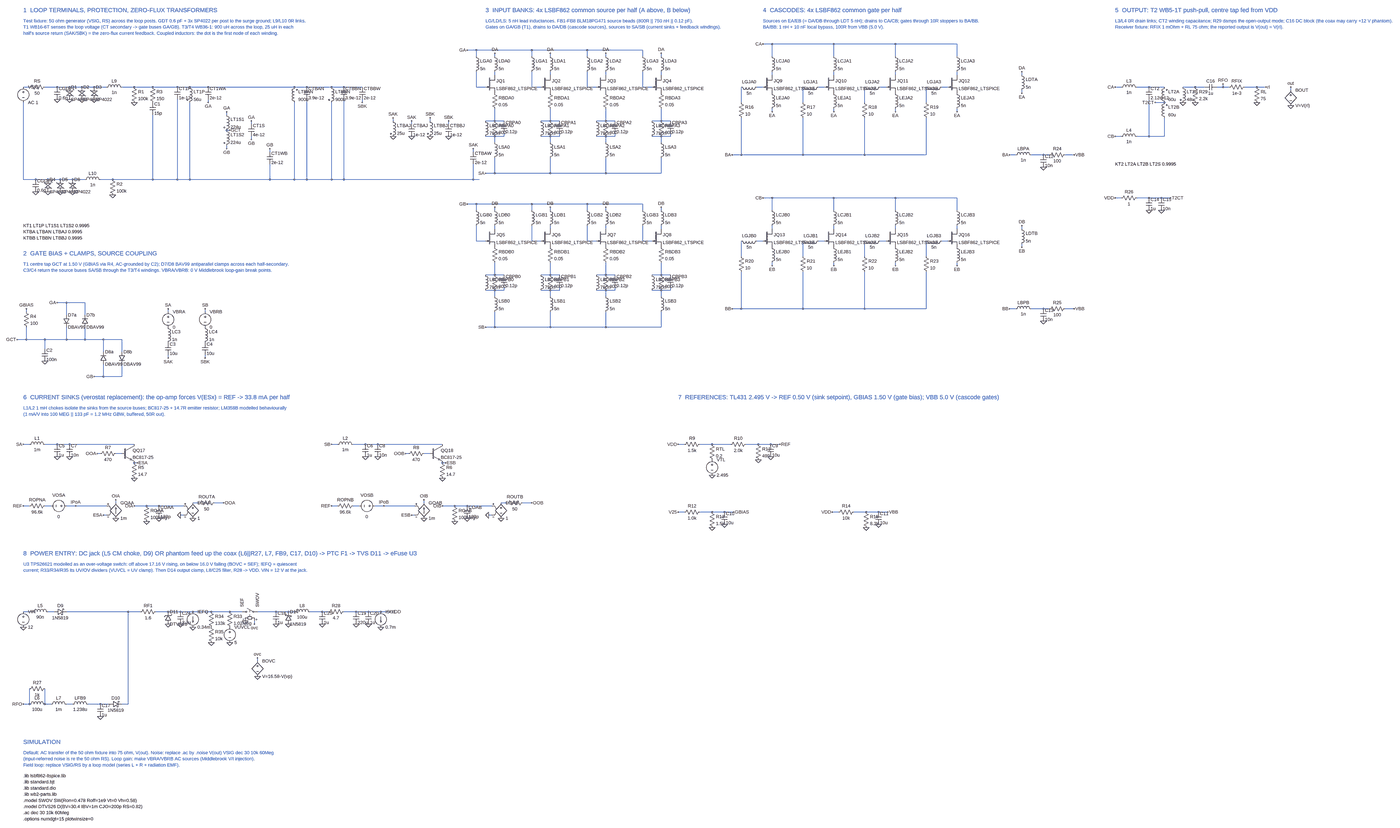
[diagram p0: schematic wb2.asc, whole sheet]
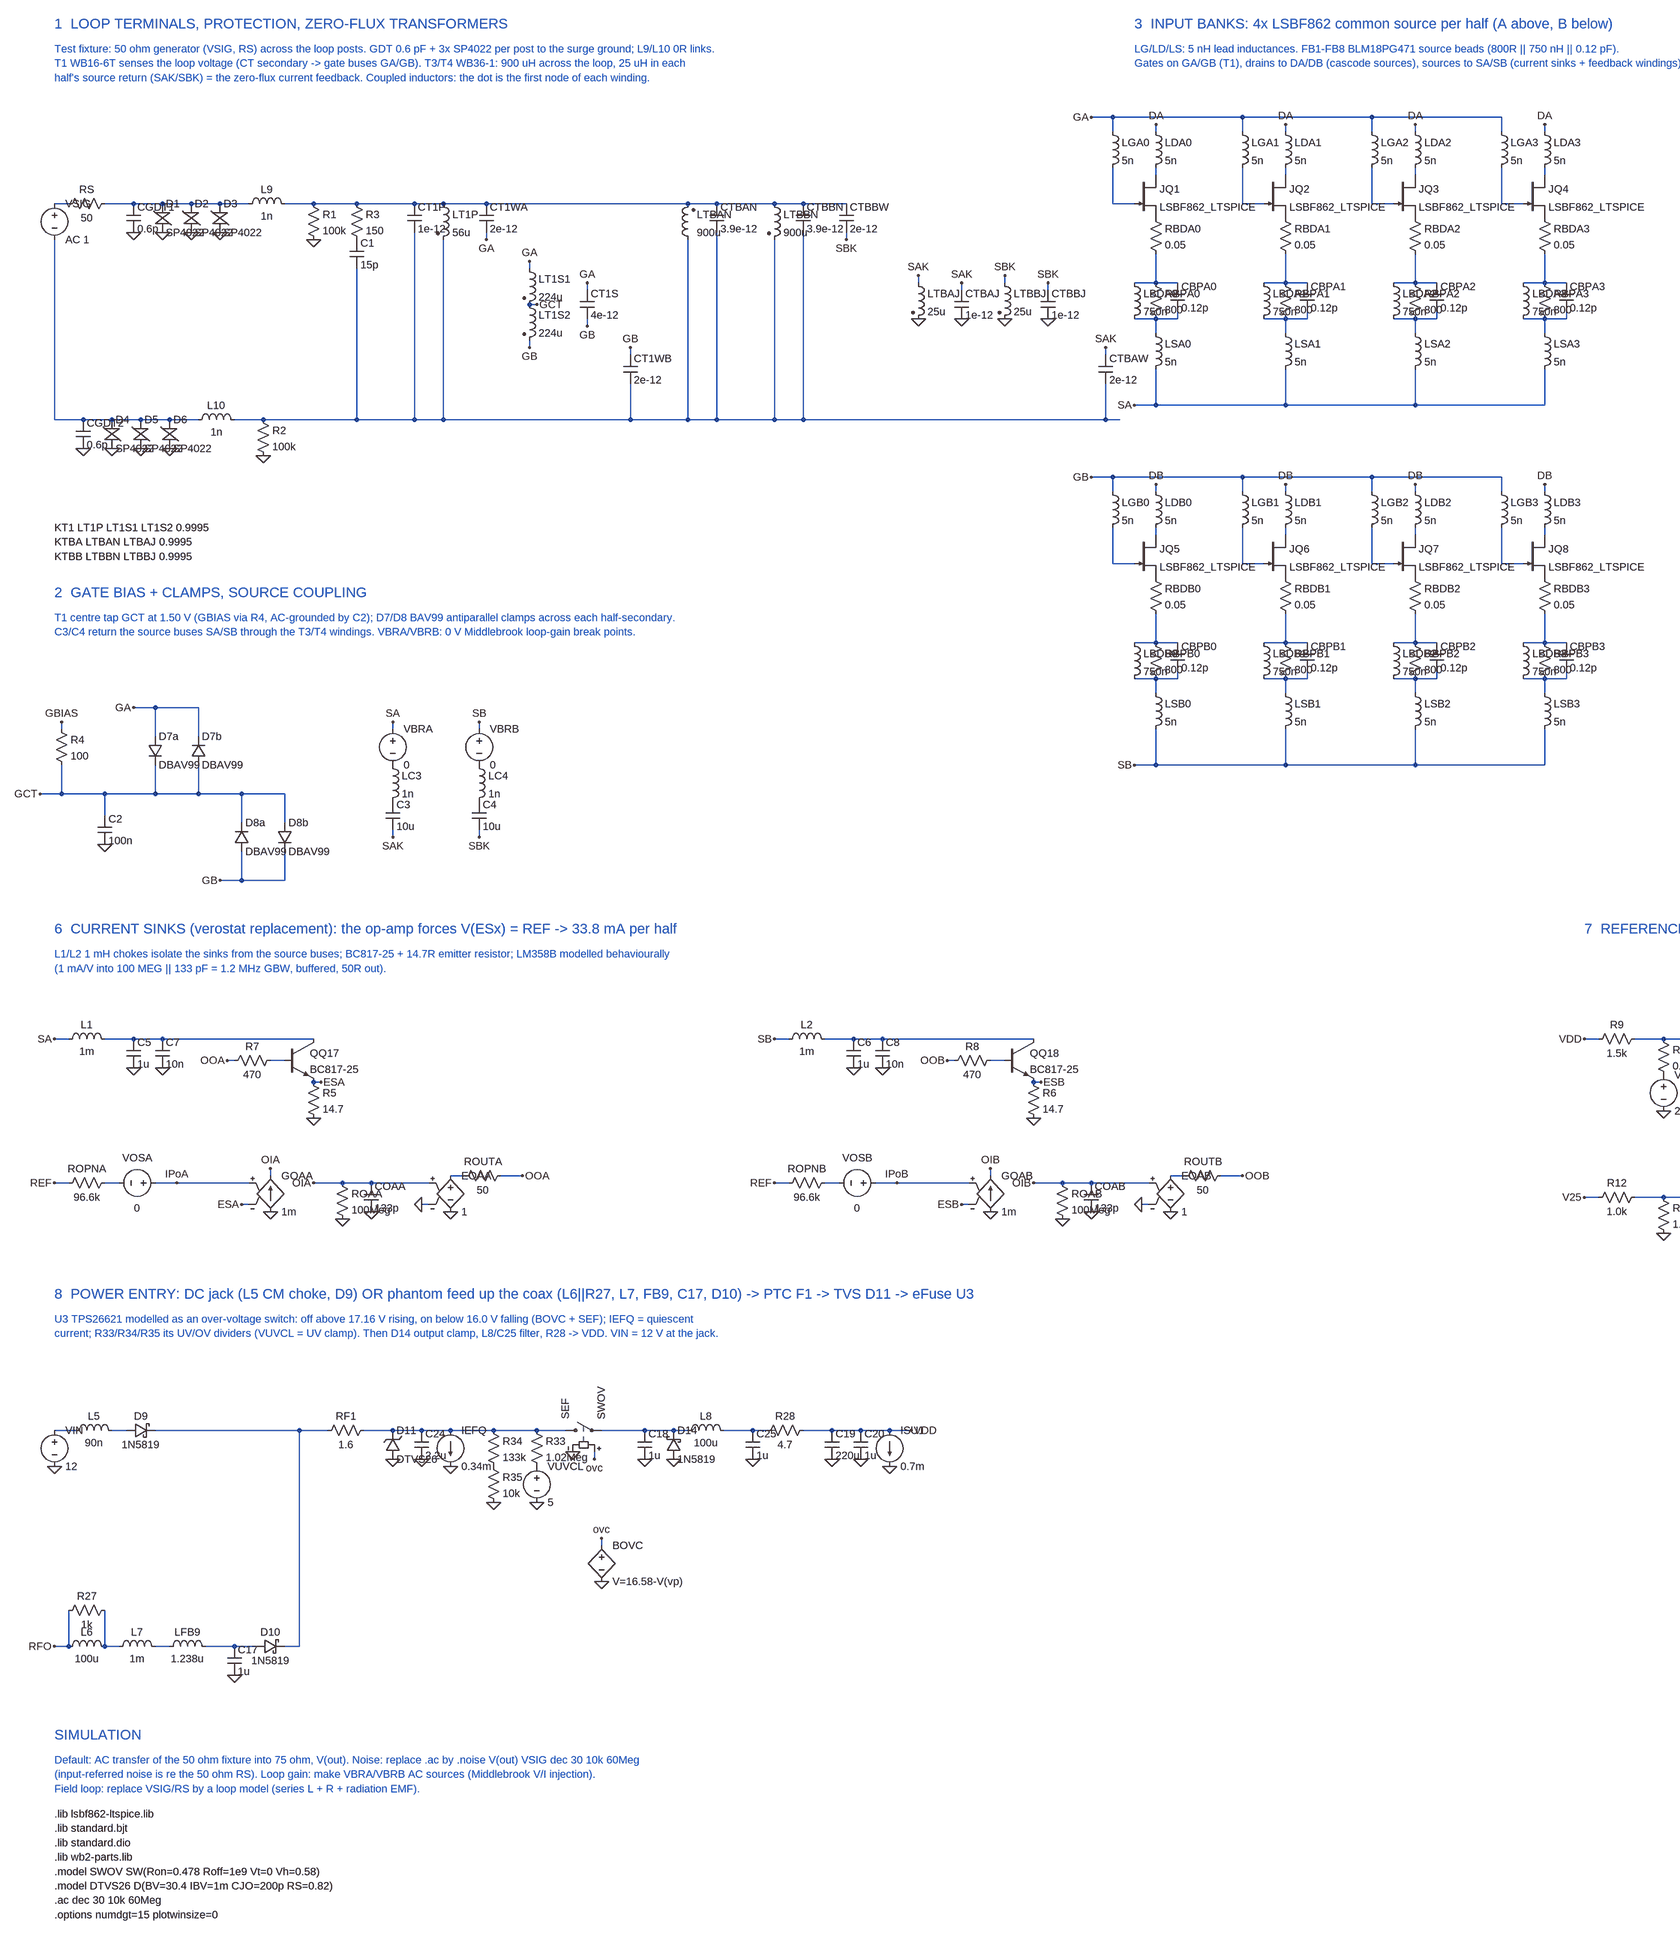
[diagram p1: schematic wb2.asc, part, row 1 of 1, column 1 of 2]
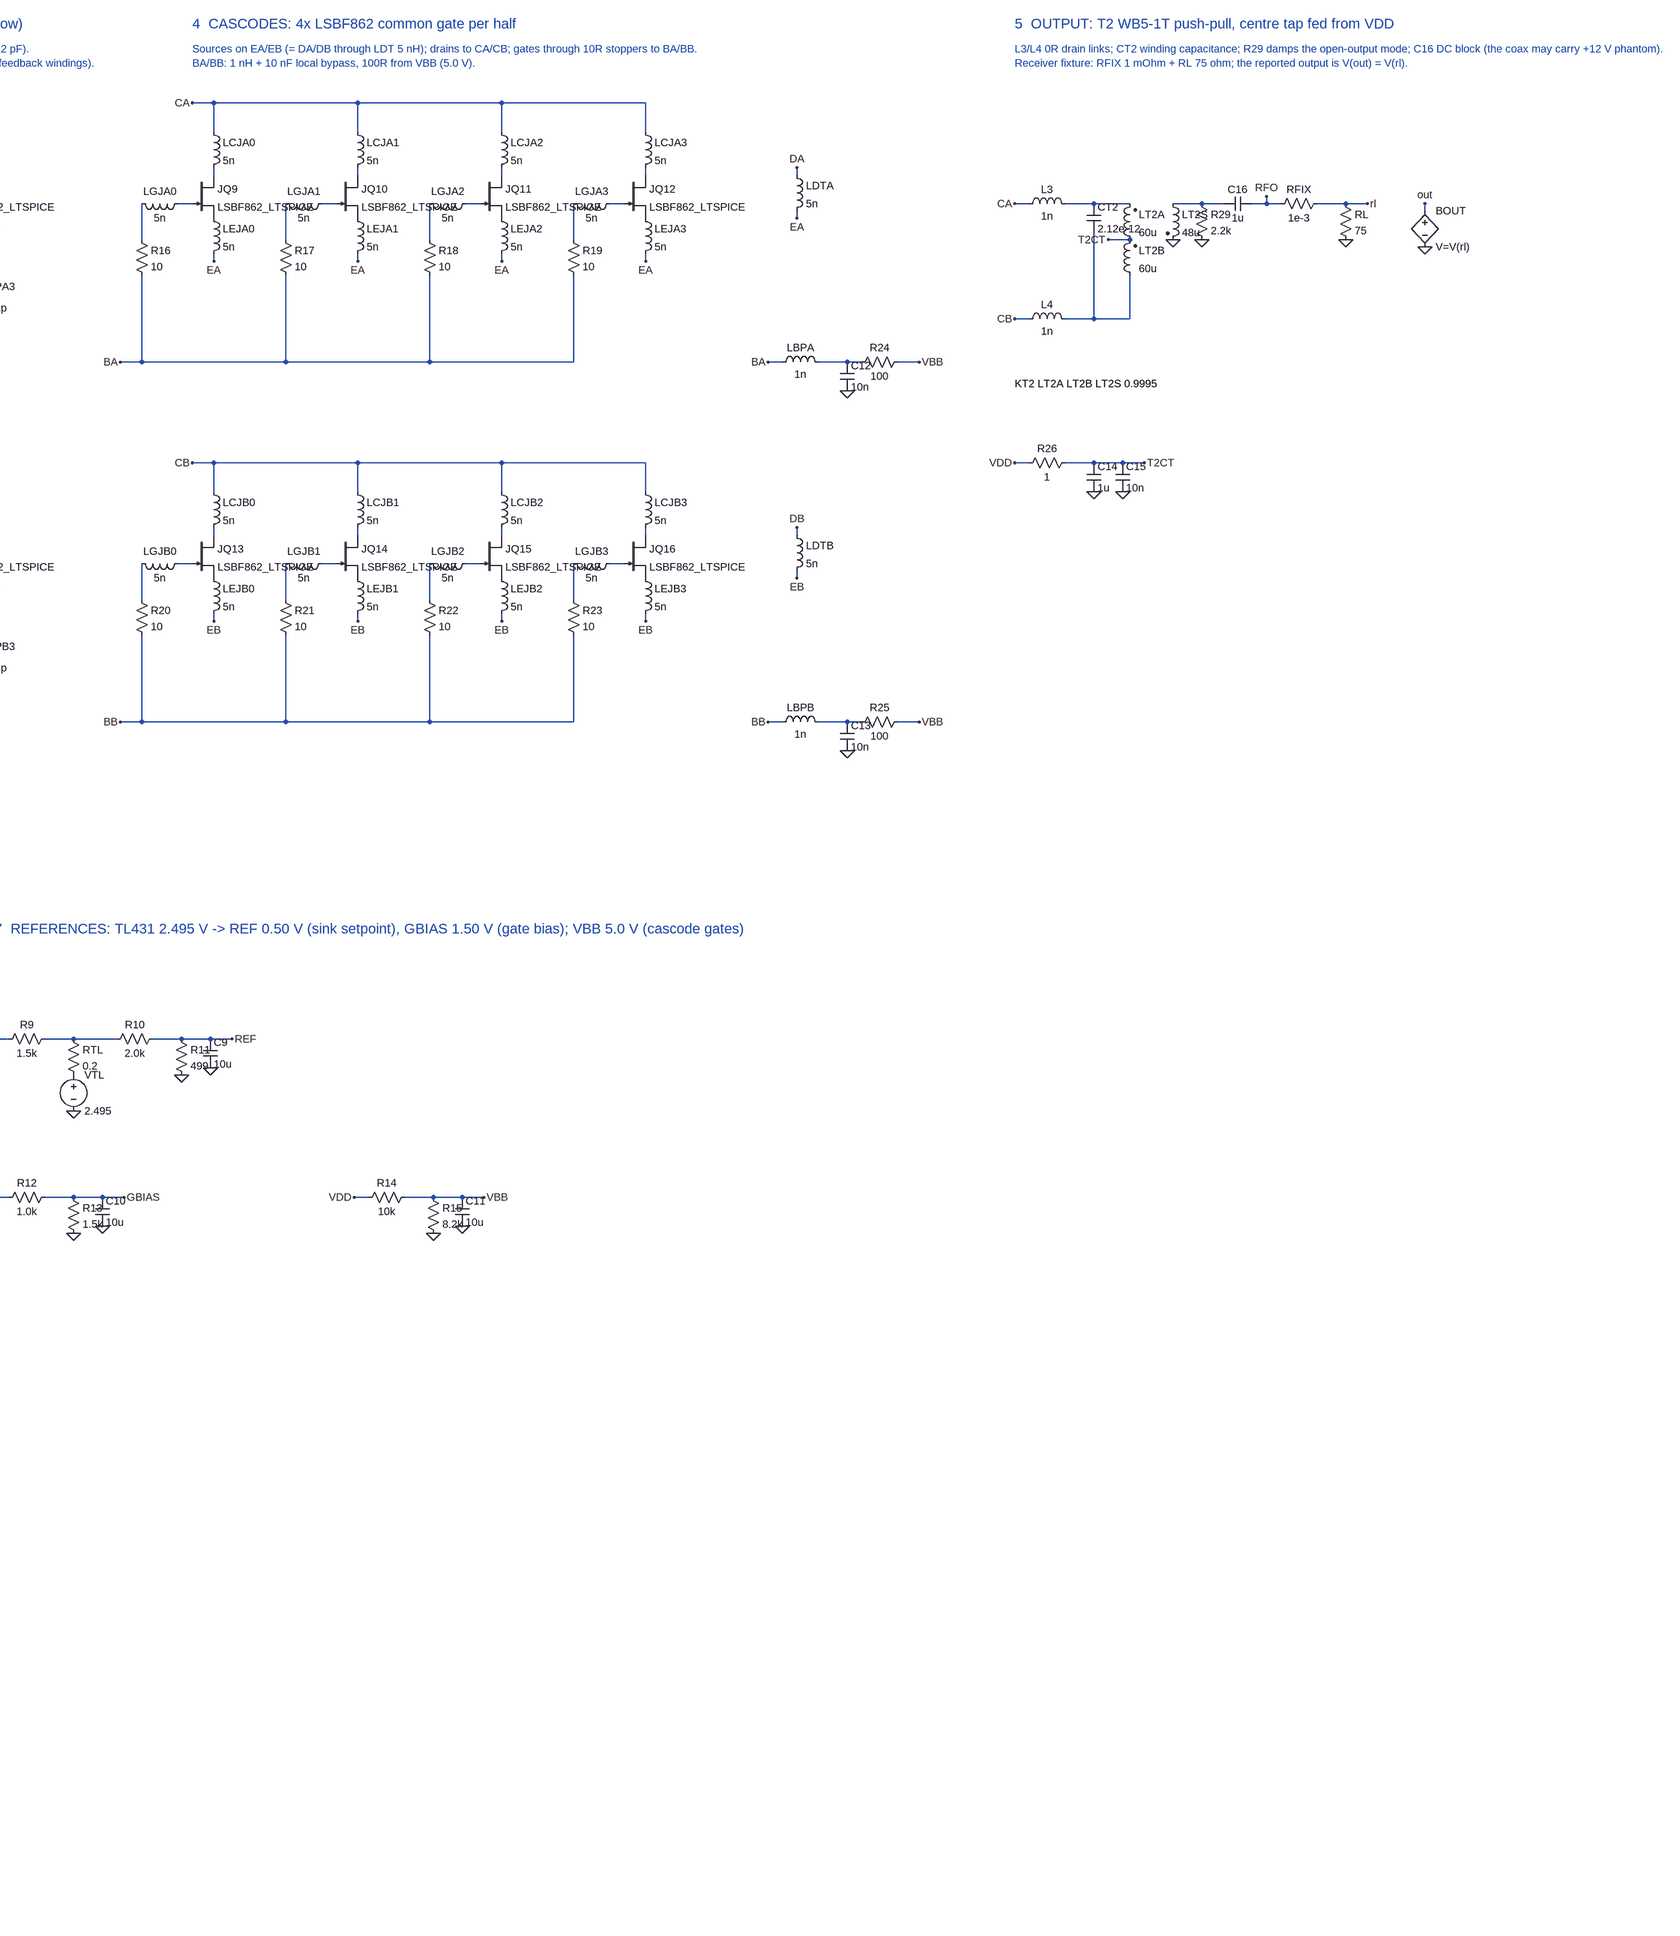
[diagram p2: schematic wb2.asc, part, row 1 of 1, column 2 of 2]
wb2.asc, the LTspice schematic file:
Version 4
SHEET 1 8000 4400
TEXT 0 -400 Left 3 ;1  LOOP TERMINALS, PROTECTION, ZERO-FLUX TRANSFORMERS
TEXT 0 -344 Left 2 ;Test fixture: 50 ohm generator (VSIG, RS) across the loop posts. GDT 0.6 pF + 3x SP4022 per post to the surge ground; L9/L10 0R links.
TEXT 0 -312 Left 2 ;T1 WB16-6T senses the loop voltage (CT secondary -> gate buses GA/GB). T3/T4 WB36-1: 900 uH across the loop, 25 uH in each
TEXT 0 -280 Left 2 ;half's source return (SAK/SBK) = the zero-flux current feedback. Coupled inductors: the dot is the first node of each winding.
SYMBOL voltage 0 -16 R0
SYMATTR InstName VSIG
SYMATTR Value AC 1
WIRE 0 0 32 0
SYMBOL res 16 16 R270
WINDOW 0 32 56 VTop 2
WINDOW 3 0 56 VBottom 2
SYMATTR InstName RS
SYMATTR Value 50
WIRE 112 0 176 0
SYMBOL cap 160 0 R0
SYMATTR InstName CGDT1
SYMATTR Value 0.6p
FLAG 176 64 0
WIRE 176 0 240 0
SYMBOL sp4022 224 0 R0
SYMATTR InstName D1
SYMATTR Value SP4022
FLAG 240 64 0
WIRE 240 0 304 0
SYMBOL sp4022 288 0 R0
SYMATTR InstName D2
SYMATTR Value SP4022
FLAG 304 64 0
WIRE 304 0 368 0
SYMBOL sp4022 352 0 R0
SYMATTR InstName D3
SYMATTR Value SP4022
FLAG 368 64 0
WIRE 368 0 432 0
SYMBOL ind 416 16 R270
WINDOW 0 32 56 VTop 2
WINDOW 3 4 56 VBottom 2
SYMATTR InstName L9
SYMATTR Value 1n
WIRE 512 0 576 0
SYMBOL res 560 -16 R0
SYMATTR InstName R1
SYMATTR Value 100k
FLAG 576 80 0
WIRE 576 0 672 0
SYMBOL res 656 -16 R0
SYMATTR InstName R3
SYMATTR Value 150
SYMBOL cap 656 80 R0
SYMATTR InstName C1
SYMATTR Value 15p
WIRE 672 144 672 480
WIRE 672 0 800 0
SYMBOL cap 784 0 R0
SYMATTR InstName CT1P
SYMATTR Value 1e-12
WIRE 800 64 800 480
WIRE 800 0 864 0
SYMBOL ind2 848 -16 R0
SYMATTR InstName LT1P
SYMATTR Value 56u
SYMATTR SpiceLine Rser=0.075
WIRE 864 80 864 480
WIRE 864 0 960 0
SYMBOL cap 944 0 R0
SYMATTR InstName CT1WA
SYMATTR Value 2e-12
WIRE 960 64 960 80
FLAG 960 80 GA
WIRE 960 0 1408 0
SYMBOL ind2 1424 96 R180
WINDOW 0 -4 72 Right 2
WINDOW 3 -4 32 Right 2
SYMATTR InstName LTBAN
SYMATTR Value 900u
SYMATTR SpiceLine Rser=0.18
WIRE 1408 80 1408 480
WIRE 1408 0 1472 0
SYMBOL cap 1488 64 R180
WINDOW 0 8 56 Right 2
WINDOW 3 8 8 Right 2
SYMATTR InstName CTBAN
SYMATTR Value 3.9e-12
WIRE 1472 64 1472 480
WIRE 1472 0 1600 0
SYMBOL ind2 1584 -16 R0
SYMATTR InstName LTBBN
SYMATTR Value 900u
SYMATTR SpiceLine Rser=0.18
WIRE 1600 80 1600 480
WIRE 1600 0 1664 0
SYMBOL cap 1648 0 R0
SYMATTR InstName CTBBN
SYMATTR Value 3.9e-12
WIRE 1664 64 1664 480
WIRE 1664 0 1760 0
SYMBOL cap 1744 0 R0
SYMATTR InstName CTBBW
SYMATTR Value 2e-12
WIRE 1760 64 1760 80
FLAG 1760 80 SBK
SYMBOL ind2 1040 128 R0
SYMATTR InstName LT1S1
SYMATTR Value 224u
SYMATTR SpiceLine Rser=0.165
WIRE 1056 144 1056 128
FLAG 1056 128 GA
SYMBOL ind2 1040 208 R0
SYMATTR InstName LT1S2
SYMATTR Value 224u
SYMATTR SpiceLine Rser=0.165
WIRE 1056 304 1056 320
FLAG 1056 320 GB
WIRE 1056 224 1072 224
FLAG 1072 224 GCT
SYMBOL cap 1168 192 R0
SYMATTR InstName CT1S
SYMATTR Value 4e-12
WIRE 1184 192 1184 176
FLAG 1184 176 GA
WIRE 1184 256 1184 272
FLAG 1184 272 GB
SYMBOL cap 1296 400 R180
WINDOW 0 8 56 Right 2
WINDOW 3 8 8 Right 2
SYMATTR InstName CT1WB
SYMATTR Value 2e-12
WIRE 1280 336 1280 320
FLAG 1280 320 GB
WIRE 1280 400 1280 480
SYMBOL ind2 1904 160 R0
SYMATTR InstName LTBAJ
SYMATTR Value 25u
SYMATTR SpiceLine Rser=0.05
WIRE 1920 176 1920 160
FLAG 1920 160 SAK
FLAG 1920 256 0
SYMBOL cap 2000 192 R0
SYMATTR InstName CTBAJ
SYMATTR Value 1e-12
WIRE 2016 192 2016 176
FLAG 2016 176 SAK
FLAG 2016 256 0
SYMBOL ind2 2096 160 R0
SYMATTR InstName LTBBJ
SYMATTR Value 25u
SYMATTR SpiceLine Rser=0.05
WIRE 2112 176 2112 160
FLAG 2112 160 SBK
FLAG 2112 256 0
SYMBOL cap 2192 192 R0
SYMATTR InstName CTBBJ
SYMATTR Value 1e-12
WIRE 2208 192 2208 176
FLAG 2208 176 SBK
FLAG 2208 256 0
SYMBOL cap 2352 400 R180
WINDOW 0 8 56 Right 2
WINDOW 3 8 8 Right 2
SYMATTR InstName CTBAW
SYMATTR Value 2e-12
WIRE 2336 336 2336 320
FLAG 2336 320 SAK
WIRE 2336 400 2336 480
WIRE 0 80 0 480
WIRE 0 480 64 480
SYMBOL cap 48 480 R0
SYMATTR InstName CGDT2
SYMATTR Value 0.6p
FLAG 64 544 0
WIRE 64 480 128 480
SYMBOL sp4022 112 480 R0
SYMATTR InstName D4
SYMATTR Value SP4022
FLAG 128 544 0
WIRE 128 480 192 480
SYMBOL sp4022 176 480 R0
SYMATTR InstName D5
SYMATTR Value SP4022
FLAG 192 544 0
WIRE 192 480 256 480
SYMBOL sp4022 240 480 R0
SYMATTR InstName D6
SYMATTR Value SP4022
FLAG 256 544 0
WIRE 256 480 320 480
SYMBOL ind 304 496 R270
WINDOW 0 32 56 VTop 2
WINDOW 3 4 56 VBottom 2
SYMATTR InstName L10
SYMATTR Value 1n
WIRE 400 480 464 480
SYMBOL res 448 464 R0
SYMATTR InstName R2
SYMATTR Value 100k
FLAG 464 560 0
WIRE 464 480 2368 480
TEXT 0 720 Left 2 !KT1 LT1P LT1S1 LT1S2 0.9995
TEXT 0 752 Left 2 !KTBA LTBAN LTBAJ 0.9995
TEXT 0 784 Left 2 !KTBB LTBBN LTBBJ 0.9995
TEXT 0 864 Left 3 ;2  GATE BIAS + CLAMPS, SOURCE COUPLING
TEXT 0 920 Left 2 ;T1 centre tap GCT at 1.50 V (GBIAS via R4, AC-grounded by C2); D7/D8 BAV99 antiparallel clamps across each half-secondary.
TEXT 0 952 Left 2 ;C3/C4 return the source buses SA/SB through the T3/T4 windings. VBRA/VBRB: 0 V Middlebrook loop-gain break points.
SYMBOL res 0 1152 R0
SYMATTR InstName R4
SYMATTR Value 100
WIRE 16 1168 16 1152
FLAG 16 1152 GBIAS
WIRE 16 1248 16 1312
SYMBOL cap 96 1360 R0
SYMATTR InstName C2
SYMATTR Value 100n
WIRE 112 1360 112 1312
FLAG 112 1424 0
SYMBOL diode 208 1184 R0
SYMATTR InstName D7a
SYMATTR Value DBAV99
WIRE 224 1184 224 1120
WIRE 224 1248 224 1312
SYMBOL diode 336 1248 R180
WINDOW 0 8 64 Right 2
WINDOW 3 8 0 Right 2
SYMATTR InstName D7b
SYMATTR Value DBAV99
WIRE 320 1184 320 1120
WIRE 320 1248 320 1312
SYMBOL diode 432 1440 R180
WINDOW 0 8 64 Right 2
WINDOW 3 8 0 Right 2
SYMATTR InstName D8a
SYMATTR Value DBAV99
WIRE 416 1376 416 1312
WIRE 416 1440 416 1504
SYMBOL diode 496 1376 R0
SYMATTR InstName D8b
SYMATTR Value DBAV99
WIRE 512 1376 512 1312
WIRE 512 1440 512 1504
WIRE 176 1120 320 1120
FLAG 176 1120 GA
WIRE -32 1312 512 1312
FLAG -32 1312 GCT
WIRE 368 1504 512 1504
FLAG 368 1504 GB
WIRE 752 1168 752 1152
FLAG 752 1152 SA
SYMBOL voltage 752 1152 R0
SYMATTR InstName VBRA
SYMATTR Value 0
SYMBOL ind 736 1232 R0
SYMATTR InstName LC3
SYMATTR Value 1n
SYMBOL cap 736 1328 R0
SYMATTR InstName C3
SYMATTR Value 10u
SYMATTR SpiceLine Rser=0.005
WIRE 752 1392 752 1408
FLAG 752 1408 SAK
WIRE 944 1168 944 1152
FLAG 944 1152 SB
SYMBOL voltage 944 1152 R0
SYMATTR InstName VBRB
SYMATTR Value 0
SYMBOL ind 928 1232 R0
SYMATTR InstName LC4
SYMATTR Value 1n
SYMBOL cap 928 1328 R0
SYMATTR InstName C4
SYMATTR Value 10u
SYMATTR SpiceLine Rser=0.005
WIRE 944 1392 944 1408
FLAG 944 1408 SBK
TEXT 2400 -400 Left 3 ;3  INPUT BANKS: 4x LSBF862 common source per half (A above, B below)
TEXT 2400 -344 Left 2 ;LG/LD/LS: 5 nH lead inductances. FB1-FB8 BLM18PG471 source beads (800R || 750 nH || 0.12 pF).
TEXT 2400 -312 Left 2 ;Gates on GA/GB (T1), drains to DA/DB (cascode sources), sources to SA/SB (current sinks + feedback windings).
SYMBOL njf 2400 -64 R0
SYMATTR InstName JQ1
SYMATTR Value LSBF862_LTSPICE
SYMBOL ind 2336 -176 R0
SYMATTR InstName LGA0
SYMATTR Value 5n
WIRE 2352 -160 2352 -192
WIRE 2352 -80 2352 0
WIRE 2352 0 2400 0
SYMBOL ind 2432 -176 R0
SYMATTR InstName LDA0
SYMATTR Value 5n
WIRE 2448 -160 2448 -176
FLAG 2448 -176 DA
WIRE 2448 -80 2448 -64
SYMBOL res 2432 16 R0
SYMATTR InstName RBDA0
SYMATTR Value 0.05
SYMBOL res 2432 160 R0
SYMATTR InstName RBPA0
SYMATTR Value 800
SYMBOL ind 2384 160 R0
SYMATTR InstName LBDA0
SYMATTR Value 750n
SYMBOL cap 2480 176 R0
SYMATTR InstName CBPA0
SYMATTR Value 0.12p
WIRE 2448 112 2448 176
WIRE 2400 176 2448 176
WIRE 2496 176 2448 176
WIRE 2400 256 2448 256
WIRE 2496 240 2496 256
WIRE 2496 256 2448 256
SYMBOL ind 2432 272 R0
SYMATTR InstName LSA0
SYMATTR Value 5n
WIRE 2448 256 2448 288
WIRE 2448 368 2448 448
SYMBOL njf 2688 -64 R0
SYMATTR InstName JQ2
SYMATTR Value LSBF862_LTSPICE
SYMBOL ind 2624 -176 R0
SYMATTR InstName LGA1
SYMATTR Value 5n
WIRE 2640 -160 2640 -192
WIRE 2640 -80 2640 0
WIRE 2640 0 2688 0
SYMBOL ind 2720 -176 R0
SYMATTR InstName LDA1
SYMATTR Value 5n
WIRE 2736 -160 2736 -176
FLAG 2736 -176 DA
WIRE 2736 -80 2736 -64
SYMBOL res 2720 16 R0
SYMATTR InstName RBDA1
SYMATTR Value 0.05
SYMBOL res 2720 160 R0
SYMATTR InstName RBPA1
SYMATTR Value 800
SYMBOL ind 2672 160 R0
SYMATTR InstName LBDA1
SYMATTR Value 750n
SYMBOL cap 2768 176 R0
SYMATTR InstName CBPA1
SYMATTR Value 0.12p
WIRE 2736 112 2736 176
WIRE 2688 176 2736 176
WIRE 2784 176 2736 176
WIRE 2688 256 2736 256
WIRE 2784 240 2784 256
WIRE 2784 256 2736 256
SYMBOL ind 2720 272 R0
SYMATTR InstName LSA1
SYMATTR Value 5n
WIRE 2736 256 2736 288
WIRE 2736 368 2736 448
SYMBOL njf 2976 -64 R0
SYMATTR InstName JQ3
SYMATTR Value LSBF862_LTSPICE
SYMBOL ind 2912 -176 R0
SYMATTR InstName LGA2
SYMATTR Value 5n
WIRE 2928 -160 2928 -192
WIRE 2928 -80 2928 0
WIRE 2928 0 2976 0
SYMBOL ind 3008 -176 R0
SYMATTR InstName LDA2
SYMATTR Value 5n
WIRE 3024 -160 3024 -176
FLAG 3024 -176 DA
WIRE 3024 -80 3024 -64
SYMBOL res 3008 16 R0
SYMATTR InstName RBDA2
SYMATTR Value 0.05
SYMBOL res 3008 160 R0
SYMATTR InstName RBPA2
SYMATTR Value 800
SYMBOL ind 2960 160 R0
SYMATTR InstName LBDA2
SYMATTR Value 750n
SYMBOL cap 3056 176 R0
SYMATTR InstName CBPA2
SYMATTR Value 0.12p
WIRE 3024 112 3024 176
WIRE 2976 176 3024 176
WIRE 3072 176 3024 176
WIRE 2976 256 3024 256
WIRE 3072 240 3072 256
WIRE 3072 256 3024 256
SYMBOL ind 3008 272 R0
SYMATTR InstName LSA2
SYMATTR Value 5n
WIRE 3024 256 3024 288
WIRE 3024 368 3024 448
SYMBOL njf 3264 -64 R0
SYMATTR InstName JQ4
SYMATTR Value LSBF862_LTSPICE
SYMBOL ind 3200 -176 R0
SYMATTR InstName LGA3
SYMATTR Value 5n
WIRE 3216 -160 3216 -192
WIRE 3216 -80 3216 0
WIRE 3216 0 3264 0
SYMBOL ind 3296 -176 R0
SYMATTR InstName LDA3
SYMATTR Value 5n
WIRE 3312 -160 3312 -176
FLAG 3312 -176 DA
WIRE 3312 -80 3312 -64
SYMBOL res 3296 16 R0
SYMATTR InstName RBDA3
SYMATTR Value 0.05
SYMBOL res 3296 160 R0
SYMATTR InstName RBPA3
SYMATTR Value 800
SYMBOL ind 3248 160 R0
SYMATTR InstName LBDA3
SYMATTR Value 750n
SYMBOL cap 3344 176 R0
SYMATTR InstName CBPA3
SYMATTR Value 0.12p
WIRE 3312 112 3312 176
WIRE 3264 176 3312 176
WIRE 3360 176 3312 176
WIRE 3264 256 3312 256
WIRE 3360 240 3360 256
WIRE 3360 256 3312 256
SYMBOL ind 3296 272 R0
SYMATTR InstName LSA3
SYMATTR Value 5n
WIRE 3312 256 3312 288
WIRE 3312 368 3312 448
WIRE 2304 -192 3216 -192
FLAG 2304 -192 GA
WIRE 2400 448 3312 448
FLAG 2400 448 SA
SYMBOL njf 2400 736 R0
SYMATTR InstName JQ5
SYMATTR Value LSBF862_LTSPICE
SYMBOL ind 2336 624 R0
SYMATTR InstName LGB0
SYMATTR Value 5n
WIRE 2352 640 2352 608
WIRE 2352 720 2352 800
WIRE 2352 800 2400 800
SYMBOL ind 2432 624 R0
SYMATTR InstName LDB0
SYMATTR Value 5n
WIRE 2448 640 2448 624
FLAG 2448 624 DB
WIRE 2448 720 2448 736
SYMBOL res 2432 816 R0
SYMATTR InstName RBDB0
SYMATTR Value 0.05
SYMBOL res 2432 960 R0
SYMATTR InstName RBPB0
SYMATTR Value 800
SYMBOL ind 2384 960 R0
SYMATTR InstName LBDB0
SYMATTR Value 750n
SYMBOL cap 2480 976 R0
SYMATTR InstName CBPB0
SYMATTR Value 0.12p
WIRE 2448 912 2448 976
WIRE 2400 976 2448 976
WIRE 2496 976 2448 976
WIRE 2400 1056 2448 1056
WIRE 2496 1040 2496 1056
WIRE 2496 1056 2448 1056
SYMBOL ind 2432 1072 R0
SYMATTR InstName LSB0
SYMATTR Value 5n
WIRE 2448 1056 2448 1088
WIRE 2448 1168 2448 1248
SYMBOL njf 2688 736 R0
SYMATTR InstName JQ6
SYMATTR Value LSBF862_LTSPICE
SYMBOL ind 2624 624 R0
SYMATTR InstName LGB1
SYMATTR Value 5n
WIRE 2640 640 2640 608
WIRE 2640 720 2640 800
WIRE 2640 800 2688 800
SYMBOL ind 2720 624 R0
SYMATTR InstName LDB1
SYMATTR Value 5n
WIRE 2736 640 2736 624
FLAG 2736 624 DB
WIRE 2736 720 2736 736
SYMBOL res 2720 816 R0
SYMATTR InstName RBDB1
SYMATTR Value 0.05
SYMBOL res 2720 960 R0
SYMATTR InstName RBPB1
SYMATTR Value 800
SYMBOL ind 2672 960 R0
SYMATTR InstName LBDB1
SYMATTR Value 750n
SYMBOL cap 2768 976 R0
SYMATTR InstName CBPB1
SYMATTR Value 0.12p
WIRE 2736 912 2736 976
WIRE 2688 976 2736 976
WIRE 2784 976 2736 976
WIRE 2688 1056 2736 1056
WIRE 2784 1040 2784 1056
WIRE 2784 1056 2736 1056
SYMBOL ind 2720 1072 R0
SYMATTR InstName LSB1
SYMATTR Value 5n
WIRE 2736 1056 2736 1088
WIRE 2736 1168 2736 1248
SYMBOL njf 2976 736 R0
SYMATTR InstName JQ7
SYMATTR Value LSBF862_LTSPICE
SYMBOL ind 2912 624 R0
SYMATTR InstName LGB2
SYMATTR Value 5n
WIRE 2928 640 2928 608
WIRE 2928 720 2928 800
WIRE 2928 800 2976 800
SYMBOL ind 3008 624 R0
SYMATTR InstName LDB2
SYMATTR Value 5n
WIRE 3024 640 3024 624
FLAG 3024 624 DB
WIRE 3024 720 3024 736
SYMBOL res 3008 816 R0
SYMATTR InstName RBDB2
SYMATTR Value 0.05
SYMBOL res 3008 960 R0
SYMATTR InstName RBPB2
SYMATTR Value 800
SYMBOL ind 2960 960 R0
SYMATTR InstName LBDB2
SYMATTR Value 750n
SYMBOL cap 3056 976 R0
SYMATTR InstName CBPB2
SYMATTR Value 0.12p
WIRE 3024 912 3024 976
WIRE 2976 976 3024 976
WIRE 3072 976 3024 976
WIRE 2976 1056 3024 1056
WIRE 3072 1040 3072 1056
WIRE 3072 1056 3024 1056
SYMBOL ind 3008 1072 R0
SYMATTR InstName LSB2
SYMATTR Value 5n
WIRE 3024 1056 3024 1088
WIRE 3024 1168 3024 1248
SYMBOL njf 3264 736 R0
SYMATTR InstName JQ8
SYMATTR Value LSBF862_LTSPICE
SYMBOL ind 3200 624 R0
SYMATTR InstName LGB3
SYMATTR Value 5n
WIRE 3216 640 3216 608
WIRE 3216 720 3216 800
WIRE 3216 800 3264 800
SYMBOL ind 3296 624 R0
SYMATTR InstName LDB3
SYMATTR Value 5n
WIRE 3312 640 3312 624
FLAG 3312 624 DB
WIRE 3312 720 3312 736
SYMBOL res 3296 816 R0
SYMATTR InstName RBDB3
SYMATTR Value 0.05
SYMBOL res 3296 960 R0
SYMATTR InstName RBPB3
SYMATTR Value 800
SYMBOL ind 3248 960 R0
SYMATTR InstName LBDB3
SYMATTR Value 750n
SYMBOL cap 3344 976 R0
SYMATTR InstName CBPB3
SYMATTR Value 0.12p
WIRE 3312 912 3312 976
WIRE 3264 976 3312 976
WIRE 3360 976 3312 976
WIRE 3264 1056 3312 1056
WIRE 3360 1040 3360 1056
WIRE 3360 1056 3312 1056
SYMBOL ind 3296 1072 R0
SYMATTR InstName LSB3
SYMATTR Value 5n
WIRE 3312 1056 3312 1088
WIRE 3312 1168 3312 1248
WIRE 2304 608 3216 608
FLAG 2304 608 GB
WIRE 2400 1248 3312 1248
FLAG 2400 1248 SB
TEXT 3840 -400 Left 3 ;4  CASCODES: 4x LSBF862 common gate per half
TEXT 3840 -344 Left 2 ;Sources on EA/EB (= DA/DB through LDT 5 nH); drains to CA/CB; gates through 10R stoppers to BA/BB.
TEXT 3840 -312 Left 2 ;BA/BB: 1 nH + 10 nF local bypass, 100R from VBB (5.0 V).
SYMBOL njf 3840 -64 R0
SYMATTR InstName JQ9
SYMATTR Value LSBF862_LTSPICE
SYMBOL ind 3872 -176 R0
SYMATTR InstName LCJA0
SYMATTR Value 5n
WIRE 3888 -160 3888 -224
WIRE 3888 -80 3888 -64
SYMBOL ind 3872 16 R0
SYMATTR InstName LEJA0
SYMATTR Value 5n
WIRE 3888 112 3888 128
FLAG 3888 128 EA
SYMBOL ind 3824 -16 R90
WINDOW 0 4 56 VBottom 2
WINDOW 3 32 56 VTop 2
SYMATTR InstName LGJA0
SYMATTR Value 5n
WIRE 3808 0 3840 0
SYMBOL res 3712 64 R0
SYMATTR InstName R16
SYMATTR Value 10
WIRE 3728 0 3728 80
WIRE 3728 160 3728 352
SYMBOL njf 4160 -64 R0
SYMATTR InstName JQ10
SYMATTR Value LSBF862_LTSPICE
SYMBOL ind 4192 -176 R0
SYMATTR InstName LCJA1
SYMATTR Value 5n
WIRE 4208 -160 4208 -224
WIRE 4208 -80 4208 -64
SYMBOL ind 4192 16 R0
SYMATTR InstName LEJA1
SYMATTR Value 5n
WIRE 4208 112 4208 128
FLAG 4208 128 EA
SYMBOL ind 4144 -16 R90
WINDOW 0 4 56 VBottom 2
WINDOW 3 32 56 VTop 2
SYMATTR InstName LGJA1
SYMATTR Value 5n
WIRE 4128 0 4160 0
SYMBOL res 4032 64 R0
SYMATTR InstName R17
SYMATTR Value 10
WIRE 4048 0 4048 80
WIRE 4048 160 4048 352
SYMBOL njf 4480 -64 R0
SYMATTR InstName JQ11
SYMATTR Value LSBF862_LTSPICE
SYMBOL ind 4512 -176 R0
SYMATTR InstName LCJA2
SYMATTR Value 5n
WIRE 4528 -160 4528 -224
WIRE 4528 -80 4528 -64
SYMBOL ind 4512 16 R0
SYMATTR InstName LEJA2
SYMATTR Value 5n
WIRE 4528 112 4528 128
FLAG 4528 128 EA
SYMBOL ind 4464 -16 R90
WINDOW 0 4 56 VBottom 2
WINDOW 3 32 56 VTop 2
SYMATTR InstName LGJA2
SYMATTR Value 5n
WIRE 4448 0 4480 0
SYMBOL res 4352 64 R0
SYMATTR InstName R18
SYMATTR Value 10
WIRE 4368 0 4368 80
WIRE 4368 160 4368 352
SYMBOL njf 4800 -64 R0
SYMATTR InstName JQ12
SYMATTR Value LSBF862_LTSPICE
SYMBOL ind 4832 -176 R0
SYMATTR InstName LCJA3
SYMATTR Value 5n
WIRE 4848 -160 4848 -224
WIRE 4848 -80 4848 -64
SYMBOL ind 4832 16 R0
SYMATTR InstName LEJA3
SYMATTR Value 5n
WIRE 4848 112 4848 128
FLAG 4848 128 EA
SYMBOL ind 4784 -16 R90
WINDOW 0 4 56 VBottom 2
WINDOW 3 32 56 VTop 2
SYMATTR InstName LGJA3
SYMATTR Value 5n
WIRE 4768 0 4800 0
SYMBOL res 4672 64 R0
SYMATTR InstName R19
SYMATTR Value 10
WIRE 4688 0 4688 80
WIRE 4688 160 4688 352
WIRE 3840 -224 4848 -224
FLAG 3840 -224 CA
WIRE 3680 352 4688 352
FLAG 3680 352 BA
FLAG 5120 352 BA
WIRE 5120 352 5152 352
SYMBOL ind 5136 368 R270
WINDOW 0 32 56 VTop 2
WINDOW 3 4 56 VBottom 2
SYMATTR InstName LBPA
SYMATTR Value 1n
WIRE 5232 352 5296 352
SYMBOL cap 5280 352 R0
SYMATTR InstName C12
SYMATTR Value 10n
SYMATTR SpiceLine Rser=0.05 Lser=0.4n
FLAG 5296 416 0
WIRE 5296 352 5328 352
SYMBOL res 5312 368 R270
WINDOW 0 32 56 VTop 2
WINDOW 3 0 56 VBottom 2
SYMATTR InstName R24
SYMATTR Value 100
WIRE 5408 352 5456 352
FLAG 5456 352 VBB
SYMBOL ind 5168 -80 R0
SYMATTR InstName LDTA
SYMATTR Value 5n
WIRE 5184 -64 5184 -80
FLAG 5184 -80 DA
WIRE 5184 16 5184 32
FLAG 5184 32 EA
SYMBOL njf 3840 736 R0
SYMATTR InstName JQ13
SYMATTR Value LSBF862_LTSPICE
SYMBOL ind 3872 624 R0
SYMATTR InstName LCJB0
SYMATTR Value 5n
WIRE 3888 640 3888 576
WIRE 3888 720 3888 736
SYMBOL ind 3872 816 R0
SYMATTR InstName LEJB0
SYMATTR Value 5n
WIRE 3888 912 3888 928
FLAG 3888 928 EB
SYMBOL ind 3824 784 R90
WINDOW 0 4 56 VBottom 2
WINDOW 3 32 56 VTop 2
SYMATTR InstName LGJB0
SYMATTR Value 5n
WIRE 3808 800 3840 800
SYMBOL res 3712 864 R0
SYMATTR InstName R20
SYMATTR Value 10
WIRE 3728 800 3728 880
WIRE 3728 960 3728 1152
SYMBOL njf 4160 736 R0
SYMATTR InstName JQ14
SYMATTR Value LSBF862_LTSPICE
SYMBOL ind 4192 624 R0
SYMATTR InstName LCJB1
SYMATTR Value 5n
WIRE 4208 640 4208 576
WIRE 4208 720 4208 736
SYMBOL ind 4192 816 R0
SYMATTR InstName LEJB1
SYMATTR Value 5n
WIRE 4208 912 4208 928
FLAG 4208 928 EB
SYMBOL ind 4144 784 R90
WINDOW 0 4 56 VBottom 2
WINDOW 3 32 56 VTop 2
SYMATTR InstName LGJB1
SYMATTR Value 5n
WIRE 4128 800 4160 800
SYMBOL res 4032 864 R0
SYMATTR InstName R21
SYMATTR Value 10
WIRE 4048 800 4048 880
WIRE 4048 960 4048 1152
SYMBOL njf 4480 736 R0
SYMATTR InstName JQ15
SYMATTR Value LSBF862_LTSPICE
SYMBOL ind 4512 624 R0
SYMATTR InstName LCJB2
SYMATTR Value 5n
WIRE 4528 640 4528 576
WIRE 4528 720 4528 736
SYMBOL ind 4512 816 R0
SYMATTR InstName LEJB2
SYMATTR Value 5n
WIRE 4528 912 4528 928
FLAG 4528 928 EB
SYMBOL ind 4464 784 R90
WINDOW 0 4 56 VBottom 2
WINDOW 3 32 56 VTop 2
SYMATTR InstName LGJB2
SYMATTR Value 5n
WIRE 4448 800 4480 800
SYMBOL res 4352 864 R0
SYMATTR InstName R22
SYMATTR Value 10
WIRE 4368 800 4368 880
WIRE 4368 960 4368 1152
SYMBOL njf 4800 736 R0
SYMATTR InstName JQ16
SYMATTR Value LSBF862_LTSPICE
SYMBOL ind 4832 624 R0
SYMATTR InstName LCJB3
SYMATTR Value 5n
WIRE 4848 640 4848 576
WIRE 4848 720 4848 736
SYMBOL ind 4832 816 R0
SYMATTR InstName LEJB3
SYMATTR Value 5n
WIRE 4848 912 4848 928
FLAG 4848 928 EB
SYMBOL ind 4784 784 R90
WINDOW 0 4 56 VBottom 2
WINDOW 3 32 56 VTop 2
SYMATTR InstName LGJB3
SYMATTR Value 5n
WIRE 4768 800 4800 800
SYMBOL res 4672 864 R0
SYMATTR InstName R23
SYMATTR Value 10
WIRE 4688 800 4688 880
WIRE 4688 960 4688 1152
WIRE 3840 576 4848 576
FLAG 3840 576 CB
WIRE 3680 1152 4688 1152
FLAG 3680 1152 BB
FLAG 5120 1152 BB
WIRE 5120 1152 5152 1152
SYMBOL ind 5136 1168 R270
WINDOW 0 32 56 VTop 2
WINDOW 3 4 56 VBottom 2
SYMATTR InstName LBPB
SYMATTR Value 1n
WIRE 5232 1152 5296 1152
SYMBOL cap 5280 1152 R0
SYMATTR InstName C13
SYMATTR Value 10n
SYMATTR SpiceLine Rser=0.05 Lser=0.4n
FLAG 5296 1216 0
WIRE 5296 1152 5328 1152
SYMBOL res 5312 1168 R270
WINDOW 0 32 56 VTop 2
WINDOW 3 0 56 VBottom 2
SYMATTR InstName R25
SYMATTR Value 100
WIRE 5408 1152 5456 1152
FLAG 5456 1152 VBB
SYMBOL ind 5168 720 R0
SYMATTR InstName LDTB
SYMATTR Value 5n
WIRE 5184 736 5184 720
FLAG 5184 720 DB
WIRE 5184 816 5184 832
FLAG 5184 832 EB
TEXT 5680 -400 Left 3 ;5  OUTPUT: T2 WB5-1T push-pull, centre tap fed from VDD
TEXT 5680 -344 Left 2 ;L3/L4 0R drain links; CT2 winding capacitance; R29 damps the open-output mode; C16 DC block (the coax may carry +12 V phantom).
TEXT 5680 -312 Left 2 ;Receiver fixture: RFIX 1 mOhm + RL 75 ohm; the reported output is V(out) = V(rl).
FLAG 5680 0 CA
WIRE 5680 0 5712 0
SYMBOL ind 5696 16 R270
WINDOW 0 32 56 VTop 2
WINDOW 3 4 56 VBottom 2
SYMATTR InstName L3
SYMATTR Value 1n
WIRE 5792 0 5856 0
SYMBOL cap 5840 0 R0
SYMATTR InstName CT2
SYMATTR Value 2.12e-12
WIRE 5856 64 5856 256
WIRE 5856 0 5936 0
SYMBOL ind2 5952 96 R180
WINDOW 0 -4 72 Right 2
WINDOW 3 -4 32 Right 2
SYMATTR InstName LT2A
SYMATTR Value 60u
SYMATTR SpiceLine Rser=0.25
SYMBOL ind2 5952 176 R180
WINDOW 0 -4 72 Right 2
WINDOW 3 -4 32 Right 2
SYMATTR InstName LT2B
SYMATTR Value 60u
SYMATTR SpiceLine Rser=0.25
FLAG 5680 256 CB
WIRE 5680 256 5712 256
SYMBOL ind 5696 272 R270
WINDOW 0 32 56 VTop 2
WINDOW 3 4 56 VBottom 2
SYMATTR InstName L4
SYMATTR Value 1n
WIRE 5792 256 5936 256
WIRE 5936 256 5936 160
WIRE 5936 80 5888 80
FLAG 5888 80 T2CT
SYMBOL ind2 6016 -16 R0
SYMATTR InstName LT2S
SYMATTR Value 48u
SYMATTR SpiceLine Rser=0.22
FLAG 6032 80 0
WIRE 6032 0 6096 0
SYMBOL res 6080 -16 R0
SYMATTR InstName R29
SYMATTR Value 2.2k
FLAG 6096 80 0
WIRE 6096 0 6144 0
SYMBOL cap 6144 16 R270
WINDOW 0 32 32 VTop 2
WINDOW 3 0 32 VBottom 2
SYMATTR InstName C16
SYMATTR Value 1u
SYMATTR SpiceLine Rser=0.02
WIRE 6208 0 6240 0
WIRE 6240 0 6240 -16
FLAG 6240 -16 RFO
WIRE 6240 0 6272 0
SYMBOL res 6256 16 R270
WINDOW 0 32 56 VTop 2
WINDOW 3 0 56 VBottom 2
SYMATTR InstName RFIX
SYMATTR Value 1e-3
WIRE 6352 0 6416 0
SYMBOL res 6400 -16 R0
SYMATTR InstName RL
SYMATTR Value 75
FLAG 6416 80 0
WIRE 6416 0 6464 0
FLAG 6464 0 rl
SYMBOL bv 6592 0 R0
SYMATTR InstName BOUT
SYMATTR Value V=V(rl)
WIRE 6592 16 6592 0
FLAG 6592 0 out
FLAG 6592 96 0
TEXT 5680 400 Left 2 !KT2 LT2A LT2B LT2S 0.9995
FLAG 5680 576 VDD
WIRE 5680 576 5712 576
SYMBOL res 5696 592 R270
WINDOW 0 32 56 VTop 2
WINDOW 3 0 56 VBottom 2
SYMATTR InstName R26
SYMATTR Value 1
WIRE 5792 576 5856 576
SYMBOL cap 5840 576 R0
SYMATTR InstName C14
SYMATTR Value 1u
SYMATTR SpiceLine Rser=0.02
FLAG 5856 640 0
WIRE 5856 576 5920 576
SYMBOL cap 5904 576 R0
SYMATTR InstName C15
SYMATTR Value 10n
FLAG 5920 640 0
WIRE 5920 576 5968 576
FLAG 5968 576 T2CT
TEXT 0 1612 Left 3 ;6  CURRENT SINKS (verostat replacement): the op-amp forces V(ESx) = REF -> 33.8 mA per half
TEXT 0 1668 Left 2 ;L1/L2 1 mH chokes isolate the sinks from the source buses; BC817-25 + 14.7R emitter resistor; LM358B modelled behaviourally
TEXT 0 1700 Left 2 ;(1 mA/V into 100 MEG || 133 pF = 1.2 MHz GBW, buffered, 50R out).
FLAG 0 1900 SA
WIRE 0 1900 32 1900
SYMBOL ind 16 1916 R270
WINDOW 0 32 56 VTop 2
WINDOW 3 4 56 VBottom 2
SYMATTR InstName L1
SYMATTR Value 1m
SYMATTR SpiceLine Rser=9.5 Rpar=60k Cpar=7.8p
WIRE 112 1900 176 1900
SYMBOL cap 160 1900 R0
SYMATTR InstName C5
SYMATTR Value 1u
SYMATTR SpiceLine Rser=0.02
FLAG 176 1964 0
WIRE 176 1900 240 1900
SYMBOL cap 224 1900 R0
SYMATTR InstName C7
SYMATTR Value 10n
FLAG 240 1964 0
WIRE 240 1900 576 1900
SYMBOL npn 512 1900 R0
SYMATTR InstName QQ17
SYMATTR Value BC817-25
SYMBOL res 560 1980 R0
SYMATTR InstName R5
SYMATTR Value 14.7
FLAG 576 2076 0
WIRE 576 1996 592 1996
FLAG 592 1996 ESA
SYMBOL res 384 1964 R270
WINDOW 0 32 56 VTop 2
WINDOW 3 0 56 VBottom 2
SYMATTR InstName R7
SYMATTR Value 470
WIRE 480 1948 512 1948
WIRE 400 1948 384 1948
FLAG 384 1948 OOA
FLAG 0 2220 REF
WIRE 0 2220 32 2220
SYMBOL res 16 2236 R270
WINDOW 0 32 56 VTop 2
WINDOW 3 0 56 VBottom 2
SYMATTR InstName ROPNA
SYMATTR Value 96.6k
WIRE 112 2220 144 2220
SYMBOL voltage 240 2220 R90
WINDOW 0 -40 56 VBottom 2
WINDOW 3 40 56 VTop 2
SYMATTR InstName VOSA
SYMATTR Value 0
WIRE 224 2220 272 2220
FLAG 272 2220 IPoA
SYMBOL g 480 2188 R0
SYMATTR InstName GOAA
SYMATTR Value 1m
WIRE 272 2220 432 2220
FLAG 480 2284 0
WIRE 480 2204 480 2188
FLAG 480 2188 OIA
WIRE 432 2268 416 2268
FLAG 416 2268 ESA
FLAG 576 2220 OIA
WIRE 576 2220 640 2220
SYMBOL res 624 2204 R0
SYMATTR InstName ROAA
SYMATTR Value 100Meg
FLAG 640 2300 0
WIRE 640 2220 704 2220
SYMBOL cap 688 2220 R0
SYMATTR InstName COAA
SYMATTR Value 133p
FLAG 704 2284 0
SYMBOL e 880 2188 R0
SYMATTR InstName EOAA
SYMATTR Value 1
WIRE 704 2220 832 2220
WIRE 832 2268 816 2268
FLAG 816 2268 0
FLAG 880 2284 0
WIRE 880 2204 912 2204
SYMBOL res 896 2220 R270
WINDOW 0 32 56 VTop 2
WINDOW 3 0 56 VBottom 2
SYMATTR InstName ROUTA
SYMATTR Value 50
WIRE 992 2204 1040 2204
FLAG 1040 2204 OOA
FLAG 1600 1900 SB
WIRE 1600 1900 1632 1900
SYMBOL ind 1616 1916 R270
WINDOW 0 32 56 VTop 2
WINDOW 3 4 56 VBottom 2
SYMATTR InstName L2
SYMATTR Value 1m
SYMATTR SpiceLine Rser=9.5 Rpar=60k Cpar=7.8p
WIRE 1712 1900 1776 1900
SYMBOL cap 1760 1900 R0
SYMATTR InstName C6
SYMATTR Value 1u
SYMATTR SpiceLine Rser=0.02
FLAG 1776 1964 0
WIRE 1776 1900 1840 1900
SYMBOL cap 1824 1900 R0
SYMATTR InstName C8
SYMATTR Value 10n
FLAG 1840 1964 0
WIRE 1840 1900 2176 1900
SYMBOL npn 2112 1900 R0
SYMATTR InstName QQ18
SYMATTR Value BC817-25
SYMBOL res 2160 1980 R0
SYMATTR InstName R6
SYMATTR Value 14.7
FLAG 2176 2076 0
WIRE 2176 1996 2192 1996
FLAG 2192 1996 ESB
SYMBOL res 1984 1964 R270
WINDOW 0 32 56 VTop 2
WINDOW 3 0 56 VBottom 2
SYMATTR InstName R8
SYMATTR Value 470
WIRE 2080 1948 2112 1948
WIRE 2000 1948 1984 1948
FLAG 1984 1948 OOB
FLAG 1600 2220 REF
WIRE 1600 2220 1632 2220
SYMBOL res 1616 2236 R270
WINDOW 0 32 56 VTop 2
WINDOW 3 0 56 VBottom 2
SYMATTR InstName ROPNB
SYMATTR Value 96.6k
WIRE 1712 2220 1744 2220
SYMBOL voltage 1840 2220 R90
WINDOW 0 -40 56 VBottom 2
WINDOW 3 40 56 VTop 2
SYMATTR InstName VOSB
SYMATTR Value 0
WIRE 1824 2220 1872 2220
FLAG 1872 2220 IPoB
SYMBOL g 2080 2188 R0
SYMATTR InstName GOAB
SYMATTR Value 1m
WIRE 1872 2220 2032 2220
FLAG 2080 2284 0
WIRE 2080 2204 2080 2188
FLAG 2080 2188 OIB
WIRE 2032 2268 2016 2268
FLAG 2016 2268 ESB
FLAG 2176 2220 OIB
WIRE 2176 2220 2240 2220
SYMBOL res 2224 2204 R0
SYMATTR InstName ROAB
SYMATTR Value 100Meg
FLAG 2240 2300 0
WIRE 2240 2220 2304 2220
SYMBOL cap 2288 2220 R0
SYMATTR InstName COAB
SYMATTR Value 133p
FLAG 2304 2284 0
SYMBOL e 2480 2188 R0
SYMATTR InstName EOAB
SYMATTR Value 1
WIRE 2304 2220 2432 2220
WIRE 2432 2268 2416 2268
FLAG 2416 2268 0
FLAG 2480 2284 0
WIRE 2480 2204 2512 2204
SYMBOL res 2496 2220 R270
WINDOW 0 32 56 VTop 2
WINDOW 3 0 56 VBottom 2
SYMATTR InstName ROUTB
SYMATTR Value 50
WIRE 2592 2204 2640 2204
FLAG 2640 2204 OOB
TEXT 3400 1612 Left 3 ;7  REFERENCES: TL431 2.495 V -> REF 0.50 V (sink setpoint), GBIAS 1.50 V (gate bias); VBB 5.0 V (cascode gates)
FLAG 3400 1900 VDD
WIRE 3400 1900 3432 1900
SYMBOL res 3416 1916 R270
WINDOW 0 32 56 VTop 2
WINDOW 3 0 56 VBottom 2
SYMATTR InstName R9
SYMATTR Value 1.5k
WIRE 3512 1900 3576 1900
SYMBOL res 3560 1884 R0
SYMATTR InstName RTL
SYMATTR Value 0.2
SYMBOL voltage 3576 1964 R0
SYMATTR InstName VTL
SYMATTR Value 2.495
FLAG 3576 2060 0
WIRE 3576 1900 3672 1900
SYMBOL res 3656 1916 R270
WINDOW 0 32 56 VTop 2
WINDOW 3 0 56 VBottom 2
SYMATTR InstName R10
SYMATTR Value 2.0k
WIRE 3752 1900 3816 1900
SYMBOL res 3800 1884 R0
SYMATTR InstName R11
SYMATTR Value 499
FLAG 3816 1980 0
WIRE 3816 1900 3880 1900
SYMBOL cap 3864 1900 R0
SYMATTR InstName C9
SYMATTR Value 10u
FLAG 3880 1964 0
WIRE 3880 1900 3928 1900
FLAG 3928 1900 REF
FLAG 3400 2252 V25
WIRE 3400 2252 3432 2252
SYMBOL res 3416 2268 R270
WINDOW 0 32 56 VTop 2
WINDOW 3 0 56 VBottom 2
SYMATTR InstName R12
SYMATTR Value 1.0k
WIRE 3512 2252 3576 2252
SYMBOL res 3560 2236 R0
SYMATTR InstName R13
SYMATTR Value 1.5k
FLAG 3576 2332 0
WIRE 3576 2252 3640 2252
SYMBOL cap 3624 2252 R0
SYMATTR InstName C10
SYMATTR Value 10u
FLAG 3640 2316 0
WIRE 3640 2252 3688 2252
FLAG 3688 2252 GBIAS
FLAG 4200 2252 VDD
WIRE 4200 2252 4232 2252
SYMBOL res 4216 2268 R270
WINDOW 0 32 56 VTop 2
WINDOW 3 0 56 VBottom 2
SYMATTR InstName R14
SYMATTR Value 10k
WIRE 4312 2252 4376 2252
SYMBOL res 4360 2236 R0
SYMATTR InstName R15
SYMATTR Value 8.2k
FLAG 4376 2332 0
WIRE 4376 2252 4440 2252
SYMBOL cap 4424 2252 R0
SYMATTR InstName C11
SYMATTR Value 10u
FLAG 4440 2316 0
WIRE 4440 2252 4488 2252
FLAG 4488 2252 VBB
TEXT 0 2780 Left 3 ;8  POWER ENTRY: DC jack (L5 CM choke, D9) OR phantom feed up the coax (L6||R27, L7, FB9, C17, D10) -> PTC F1 -> TVS D11 -> eFuse U3
TEXT 0 2836 Left 2 ;U3 TPS26621 modelled as an over-voltage switch: off above 17.16 V rising, on below 16.0 V falling (BOVC + SEF); IEFQ = quiescent
TEXT 0 2868 Left 2 ;current; R33/R34/R35 its UV/OV dividers (VUVCL = UV clamp). Then D14 output clamp, L8/C25 filter, R28 -> VDD. VIN = 12 V at the jack.
FLAG 0 3580 RFO
WIRE 0 3580 32 3580
SYMBOL ind 16 3596 R270
WINDOW 0 32 56 VTop 2
WINDOW 3 4 56 VBottom 2
SYMATTR InstName L6
SYMATTR Value 100u
SYMATTR SpiceLine Rser=0.99 Cpar=6.8p
SYMBOL res 16 3516 R270
WINDOW 0 32 56 VTop 2
WINDOW 3 0 56 VBottom 2
SYMATTR InstName R27
SYMATTR Value 1k
WIRE 32 3580 32 3500
WIRE 112 3580 112 3500
WIRE 112 3580 144 3580
SYMBOL ind 128 3596 R270
WINDOW 0 32 56 VTop 2
WINDOW 3 4 56 VBottom 2
SYMATTR InstName L7
SYMATTR Value 1m
SYMATTR SpiceLine Rser=9.5 Cpar=7.8p
WIRE 224 3580 256 3580
SYMBOL ind 240 3596 R270
WINDOW 0 32 56 VTop 2
WINDOW 3 4 56 VBottom 2
SYMATTR InstName LFB9
SYMATTR Value 1.238u
SYMATTR SpiceLine Rser=0.15 Rpar=850 Cpar=0.167p
WIRE 336 3580 400 3580
SYMBOL cap 384 3580 R0
SYMATTR InstName C17
SYMATTR Value 1u
FLAG 400 3644 0
WIRE 400 3580 448 3580
SYMBOL schottky 448 3596 R270
WINDOW 0 32 32 VTop 2
WINDOW 3 0 32 VBottom 2
SYMATTR InstName D10
SYMATTR Value 1N5819
WIRE 512 3580 544 3580
SYMBOL voltage 0 3084 R0
SYMATTR InstName VIN
SYMATTR Value 12
FLAG 0 3180 0
WIRE 0 3100 48 3100
SYMBOL ind 32 3116 R270
WINDOW 0 32 56 VTop 2
WINDOW 3 4 56 VBottom 2
SYMATTR InstName L5
SYMATTR Value 90n
SYMATTR SpiceLine Rser=0.41
WIRE 128 3100 160 3100
SYMBOL schottky 160 3116 R270
WINDOW 0 32 32 VTop 2
WINDOW 3 0 32 VBottom 2
SYMATTR InstName D9
SYMATTR Value 1N5819
WIRE 224 3100 544 3100
WIRE 544 3580 544 3100
WIRE 544 3100 608 3100
SYMBOL res 592 3116 R270
WINDOW 0 32 56 VTop 2
WINDOW 3 0 56 VBottom 2
SYMATTR InstName RF1
SYMATTR Value 1.6
WIRE 688 3100 752 3100
SYMBOL zener 768 3164 R180
WINDOW 0 8 64 Right 2
WINDOW 3 8 0 Right 2
SYMATTR InstName D11
SYMATTR Value DTVS26
FLAG 752 3164 0
WIRE 752 3100 816 3100
SYMBOL cap 800 3100 R0
SYMATTR InstName C24
SYMATTR Value 2.2u
SYMATTR SpiceLine Rser=0.02
FLAG 816 3164 0
WIRE 816 3100 880 3100
SYMBOL current 880 3100 R0
SYMATTR InstName IEFQ
SYMATTR Value 0.34m
FLAG 880 3180 0
WIRE 880 3100 976 3100
SYMBOL res 960 3084 R0
SYMATTR InstName R34
SYMATTR Value 133k
SYMBOL res 960 3164 R0
SYMATTR InstName R35
SYMATTR Value 10k
FLAG 976 3260 0
WIRE 976 3100 1072 3100
SYMBOL res 1056 3084 R0
SYMATTR InstName R33
SYMATTR Value 1.02Meg
SYMBOL voltage 1072 3164 R0
SYMATTR InstName VUVCL
SYMATTR Value 5
FLAG 1072 3260 0
WIRE 1072 3100 1136 3100
SYMBOL sw 1120 3100 R270
SYMATTR InstName SEF
SYMATTR Value SWOV
WIRE 1200 3148 1200 3164
FLAG 1200 3164 ovc
FLAG 1152 3148 0
SYMBOL bv 1216 3340 R0
SYMATTR InstName BOVC
SYMATTR Value V=16.58-V(vp)
WIRE 1216 3356 1216 3340
FLAG 1216 3340 ovc
FLAG 1216 3436 0
WIRE 1216 3100 1312 3100
SYMBOL cap 1296 3100 R0
SYMATTR InstName C18
SYMATTR Value 1u
FLAG 1312 3164 0
WIRE 1312 3100 1376 3100
SYMBOL schottky 1392 3164 R180
WINDOW 0 8 64 Right 2
WINDOW 3 8 0 Right 2
SYMATTR InstName D14
SYMATTR Value 1N5819
FLAG 1376 3164 0
WIRE 1376 3100 1408 3100
SYMBOL ind 1392 3116 R270
WINDOW 0 32 56 VTop 2
WINDOW 3 4 56 VBottom 2
SYMATTR InstName L8
SYMATTR Value 100u
SYMATTR SpiceLine Rser=0.99 Cpar=6.8p
WIRE 1488 3100 1552 3100
SYMBOL cap 1536 3100 R0
SYMATTR InstName C25
SYMATTR Value 1u
FLAG 1552 3164 0
WIRE 1552 3100 1584 3100
SYMBOL res 1568 3116 R270
WINDOW 0 32 56 VTop 2
WINDOW 3 0 56 VBottom 2
SYMATTR InstName R28
SYMATTR Value 4.7
WIRE 1664 3100 1728 3100
SYMBOL cap 1712 3100 R0
SYMATTR InstName C19
SYMATTR Value 220u
SYMATTR SpiceLine Rser=0.1
FLAG 1728 3164 0
WIRE 1728 3100 1792 3100
SYMBOL cap 1776 3100 R0
SYMATTR InstName C20
SYMATTR Value 1u
FLAG 1792 3164 0
WIRE 1792 3100 1856 3100
SYMBOL current 1856 3100 R0
SYMATTR InstName ISU1
SYMATTR Value 0.7m
FLAG 1856 3180 0
WIRE 1856 3100 1904 3100
FLAG 1904 3100 VDD
TEXT 0 3900 Left 3 ;SIMULATION
TEXT 0 3956 Left 2 ;Default: AC transfer of the 50 ohm fixture into 75 ohm, V(out). Noise: replace .ac by .noise V(out) VSIG dec 30 10k 60Meg
TEXT 0 3988 Left 2 ;(input-referred noise is re the 50 ohm RS). Loop gain: make VBRA/VBRB AC sources (Middlebrook V/I injection).
TEXT 0 4020 Left 2 ;Field loop: replace VSIG/RS by a loop model (series L + R + radiation EMF).
TEXT 0 4076 Left 2 !.lib lsbf862-ltspice.lib
TEXT 0 4108 Left 2 !.lib standard.bjt
TEXT 0 4140 Left 2 !.lib standard.dio
TEXT 0 4172 Left 2 !.lib wb2-parts.lib
TEXT 0 4204 Left 2 !.model SWOV SW(Ron=0.478 Roff=1e9 Vt=0 Vh=0.58)
TEXT 0 4236 Left 2 !.model DTVS26 D(BV=30.4 IBV=1m CJO=200p RS=0.82)
TEXT 0 4268 Left 2 !.ac dec 30 10k 60Meg
TEXT 0 4300 Left 2 !.options numdgt=15 plotwinsize=0

The netlist it stands for:
* wb2.asc
VSIG N001 N005 AC 1
RS N001 N002 50
CGDT1 N002 0 0.6p
XD1 N002 0 SP4022  ; pins A B
XD2 N002 0 SP4022  ; pins A B
XD3 N002 0 SP4022  ; pins A B
L9 N002 N003 1n
R1 N003 0 100k
R3 N003 P001 150
C1 P001 N004 15p
CT1P N003 N004 1e-12
LT1P N003 N004 56u Rser=0.075
CT1WA N003 GA 2e-12
LTBAN N004 N003 900u Rser=0.18
CTBAN N004 N003 3.9e-12
LTBBN N003 N004 900u Rser=0.18
CTBBN N003 N004 3.9e-12
CTBBW N003 SBK 2e-12
LT1S1 GA GCT 224u Rser=0.165
LT1S2 GCT GB 224u Rser=0.165
CT1S GA GB 4e-12
CT1WB N004 GB 2e-12
LTBAJ SAK 0 25u Rser=0.05
CTBAJ SAK 0 1e-12
LTBBJ SBK 0 25u Rser=0.05
CTBBJ SBK 0 1e-12
CTBAW N004 SAK 2e-12
CGDT2 N005 0 0.6p
XD4 N005 0 SP4022  ; pins A B
XD5 N005 0 SP4022  ; pins A B
XD6 N005 0 SP4022  ; pins A B
L10 N005 N004 1n
R2 N004 0 100k
R4 GBIAS GCT 100
C2 GCT 0 100n
D7a GA GCT DBAV99
D7b GCT GA DBAV99
D8a GB GCT DBAV99
D8b GCT GB DBAV99
VBRA SA P002 0
LC3 P002 P003 1n
C3 P003 SAK 10u Rser=0.005
VBRB SB P004 0
LC4 P004 P005 1n
C4 P005 SBK 10u Rser=0.005
JQ1 N007 N006 P006 LSBF862_LTSPICE
LGA0 GA N006 5n
LDA0 DA N007 5n
RBDA0 P006 N008 0.05
RBPA0 N008 N009 800
LBDA0 N008 N009 750n
CBPA0 N008 N009 0.12p
LSA0 N009 SA 5n
JQ2 N011 N010 P007 LSBF862_LTSPICE
LGA1 GA N010 5n
LDA1 DA N011 5n
RBDA1 P007 N012 0.05
RBPA1 N012 N013 800
LBDA1 N012 N013 750n
CBPA1 N012 N013 0.12p
LSA1 N013 SA 5n
JQ3 N015 N014 P008 LSBF862_LTSPICE
LGA2 GA N014 5n
LDA2 DA N015 5n
RBDA2 P008 N016 0.05
RBPA2 N016 N017 800
LBDA2 N016 N017 750n
CBPA2 N016 N017 0.12p
LSA2 N017 SA 5n
JQ4 N019 N018 P009 LSBF862_LTSPICE
LGA3 GA N018 5n
LDA3 DA N019 5n
RBDA3 P009 N020 0.05
RBPA3 N020 N021 800
LBDA3 N020 N021 750n
CBPA3 N020 N021 0.12p
LSA3 N021 SA 5n
JQ5 N023 N022 P010 LSBF862_LTSPICE
LGB0 GB N022 5n
LDB0 DB N023 5n
RBDB0 P010 N024 0.05
RBPB0 N024 N025 800
LBDB0 N024 N025 750n
CBPB0 N024 N025 0.12p
LSB0 N025 SB 5n
JQ6 N027 N026 P011 LSBF862_LTSPICE
LGB1 GB N026 5n
LDB1 DB N027 5n
RBDB1 P011 N028 0.05
RBPB1 N028 N029 800
LBDB1 N028 N029 750n
CBPB1 N028 N029 0.12p
LSB1 N029 SB 5n
JQ7 N031 N030 P012 LSBF862_LTSPICE
LGB2 GB N030 5n
LDB2 DB N031 5n
RBDB2 P012 N032 0.05
RBPB2 N032 N033 800
LBDB2 N032 N033 750n
CBPB2 N032 N033 0.12p
LSB2 N033 SB 5n
JQ8 N035 N034 P013 LSBF862_LTSPICE
LGB3 GB N034 5n
LDB3 DB N035 5n
RBDB3 P013 N036 0.05
RBPB3 N036 N037 800
LBDB3 N036 N037 750n
CBPB3 N036 N037 0.12p
LSB3 N037 SB 5n
JQ9 N038 N039 P014 LSBF862_LTSPICE
LCJA0 CA N038 5n
LEJA0 P014 EA 5n
LGJA0 N039 N040 5n
R16 N040 BA 10
JQ10 N041 N042 P015 LSBF862_LTSPICE
LCJA1 CA N041 5n
LEJA1 P015 EA 5n
LGJA1 N042 N043 5n
R17 N043 BA 10
JQ11 N044 N045 P016 LSBF862_LTSPICE
LCJA2 CA N044 5n
LEJA2 P016 EA 5n
LGJA2 N045 N046 5n
R18 N046 BA 10
JQ12 N047 N048 P017 LSBF862_LTSPICE
LCJA3 CA N047 5n
LEJA3 P017 EA 5n
LGJA3 N048 N049 5n
R19 N049 BA 10
LBPA BA N050 1n
C12 N050 0 10n Rser=0.05 Lser=0.4n
R24 N050 VBB 100
LDTA DA EA 5n
JQ13 N051 N052 P018 LSBF862_LTSPICE
LCJB0 CB N051 5n
LEJB0 P018 EB 5n
LGJB0 N052 N053 5n
R20 N053 BB 10
JQ14 N054 N055 P019 LSBF862_LTSPICE
LCJB1 CB N054 5n
LEJB1 P019 EB 5n
LGJB1 N055 N056 5n
R21 N056 BB 10
JQ15 N057 N058 P020 LSBF862_LTSPICE
LCJB2 CB N057 5n
LEJB2 P020 EB 5n
LGJB2 N058 N059 5n
R22 N059 BB 10
JQ16 N060 N061 P021 LSBF862_LTSPICE
LCJB3 CB N060 5n
LEJB3 P021 EB 5n
LGJB3 N061 N062 5n
R23 N062 BB 10
LBPB BB N063 1n
C13 N063 0 10n Rser=0.05 Lser=0.4n
R25 N063 VBB 100
LDTB DB EB 5n
L3 CA N064 1n
CT2 N064 N065 2.12e-12
LT2A T2CT N064 60u Rser=0.25
LT2B N065 T2CT 60u Rser=0.25
L4 CB N065 1n
LT2S N066 0 48u Rser=0.22
R29 N066 0 2.2k
C16 N066 RFO 1u Rser=0.02
RFIX RFO rl 1e-3
RL rl 0 75
BOUT out 0 V=V(rl)
R26 VDD T2CT 1
C14 T2CT 0 1u Rser=0.02
C15 T2CT 0 10n
L1 SA N067 1m Rser=9.5 Rpar=60k Cpar=7.8p
C5 N067 0 1u Rser=0.02
C7 N067 0 10n
QQ17 N067 N068 ESA 0 BC817-25
R5 ESA 0 14.7
R7 OOA N068 470
ROPNA REF N069 96.6k
VOSA IPoA N069 0
GOAA 0 OIA IPoA ESA 1m
ROAA OIA 0 100Meg
COAA OIA 0 133p
EOAA N070 0 OIA 0 1
ROUTA N070 OOA 50
L2 SB N071 1m Rser=9.5 Rpar=60k Cpar=7.8p
C6 N071 0 1u Rser=0.02
C8 N071 0 10n
QQ18 N071 N072 ESB 0 BC817-25
R6 ESB 0 14.7
R8 OOB N072 470
ROPNB REF N073 96.6k
VOSB IPoB N073 0
GOAB 0 OIB IPoB ESB 1m
ROAB OIB 0 100Meg
COAB OIB 0 133p
EOAB N074 0 OIB 0 1
ROUTB N074 OOB 50
R9 VDD N075 1.5k
RTL N075 P022 0.2
VTL P022 0 2.495
R10 N075 REF 2.0k
R11 REF 0 499
C9 REF 0 10u
R12 V25 GBIAS 1.0k
R13 GBIAS 0 1.5k
C10 GBIAS 0 10u
R14 VDD VBB 10k
R15 VBB 0 8.2k
C11 VBB 0 10u
L6 RFO N076 100u Rser=0.99 Cpar=6.8p
R27 RFO N076 1k
L7 N076 N077 1m Rser=9.5 Cpar=7.8p
LFB9 N077 N078 1.238u Rser=0.15 Rpar=850 Cpar=0.167p
C17 N078 0 1u
D10 N078 N079 1N5819
VIN N080 0 12
L5 N080 N081 90n Rser=0.41
D9 N081 N079 1N5819
RF1 N079 N082 1.6
D11 0 N082 DTVS26
C24 N082 0 2.2u Rser=0.02
IEFQ N082 0 0.34m
R34 N082 P023 133k
R35 P023 0 10k
R33 N082 P024 1.02Meg
VUVCL P024 0 5
SEF N082 N083 ovc 0 SWOV
BOVC ovc 0 V=16.58-V(vp)
C18 N083 0 1u
D14 0 N083 1N5819
L8 N083 N084 100u Rser=0.99 Cpar=6.8p
C25 N084 0 1u
R28 N084 VDD 4.7
C19 VDD 0 220u Rser=0.1
C20 VDD 0 1u
ISU1 VDD 0 0.7m
.model D D
.lib standard.dio
.model NPN NPN
.model PNP PNP
.lib standard.bjt
.model NJF NJF
.model PJF PJF
.lib standard.jft
* 1  LOOP TERMINALS, PROTECTION, ZERO-FLUX TRANSFORMERS
* Test fixture: 50 ohm generator (VSIG, RS) across the loop posts. GDT 0.6 pF + 3x SP4022 per post to the surge ground; L9/L10 0R links.
* T1 WB16-6T senses the loop voltage (CT secondary -> gate buses GA/GB). T3/T4 WB36-1: 900 uH across the loop, 25 uH in each
* half's source return (SAK/SBK) = the zero-flux current feedback. Coupled inductors: the dot is the first node of each winding.
KT1 LT1P LT1S1 LT1S2 0.9995
KTBA LTBAN LTBAJ 0.9995
KTBB LTBBN LTBBJ 0.9995
* 2  GATE BIAS + CLAMPS, SOURCE COUPLING
* T1 centre tap GCT at 1.50 V (GBIAS via R4, AC-grounded by C2); D7/D8 BAV99 antiparallel clamps across each half-secondary.
* C3/C4 return the source buses SA/SB through the T3/T4 windings. VBRA/VBRB: 0 V Middlebrook loop-gain break points.
* 3  INPUT BANKS: 4x LSBF862 common source per half (A above, B below)
* LG/LD/LS: 5 nH lead inductances. FB1-FB8 BLM18PG471 source beads (800R || 750 nH || 0.12 pF).
* Gates on GA/GB (T1), drains to DA/DB (cascode sources), sources to SA/SB (current sinks + feedback windings).
* 4  CASCODES: 4x LSBF862 common gate per half
* Sources on EA/EB (= DA/DB through LDT 5 nH); drains to CA/CB; gates through 10R stoppers to BA/BB.
* BA/BB: 1 nH + 10 nF local bypass, 100R from VBB (5.0 V).
* 5  OUTPUT: T2 WB5-1T push-pull, centre tap fed from VDD
* L3/L4 0R drain links; CT2 winding capacitance; R29 damps the open-output mode; C16 DC block (the coax may carry +12 V phantom).
* Receiver fixture: RFIX 1 mOhm + RL 75 ohm; the reported output is V(out) = V(rl).
KT2 LT2A LT2B LT2S 0.9995
* 6  CURRENT SINKS (verostat replacement): the op-amp forces V(ESx) = REF -> 33.8 mA per half
* L1/L2 1 mH chokes isolate the sinks from the source buses; BC817-25 + 14.7R emitter resistor; LM358B modelled behaviourally
* (1 mA/V into 100 MEG || 133 pF = 1.2 MHz GBW, buffered, 50R out).
* 7  REFERENCES: TL431 2.495 V -> REF 0.50 V (sink setpoint), GBIAS 1.50 V (gate bias); VBB 5.0 V (cascode gates)
* 8  POWER ENTRY: DC jack (L5 CM choke, D9) OR phantom feed up the coax (L6||R27, L7, FB9, C17, D10) -> PTC F1 -> TVS D11 -> eFuse U3
* U3 TPS26621 modelled as an over-voltage switch: off above 17.16 V rising, on below 16.0 V falling (BOVC + SEF); IEFQ = quiescent
* current; R33/R34/R35 its UV/OV dividers (VUVCL = UV clamp). Then D14 output clamp, L8/C25 filter, R28 -> VDD. VIN = 12 V at the jack.
* SIMULATION
* Default: AC transfer of the 50 ohm fixture into 75 ohm, V(out). Noise: replace .ac by .noise V(out) VSIG dec 30 10k 60Meg
* (input-referred noise is re the 50 ohm RS). Loop gain: make VBRA/VBRB AC sources (Middlebrook V/I injection).
* Field loop: replace VSIG/RS by a loop model (series L + R + radiation EMF).
.lib lsbf862-ltspice.lib
.lib standard.bjt
.lib standard.dio
.lib wb2-parts.lib
.model SWOV SW(Ron=0.478 Roff=1e9 Vt=0 Vh=0.58)
.model DTVS26 D(BV=30.4 IBV=1m CJO=200p RS=0.82)
.ac dec 30 10k 60Meg
.options numdgt=15 plotwinsize=0
.backanno
.end